# EasyEDA Pro project 级联多电平.epro

# Schematic Schematic1
Assembly Variant: Basic; Board Name: Board1; Create Date: 2026-01-28; Page Name: P1; Project Name: 级联多电平; Schematic Name: Schematic1; Update Date: 2026-01-28; BladeWidth: 10; Company: 嘉立创EDA; Page Size: A4; RegionStart: 1; ShowBorder: 1; TitleBlock: 1; TitleBlockPosition: 3; Version: V1.0; XRegionCount: 6; YRegionCount: 4
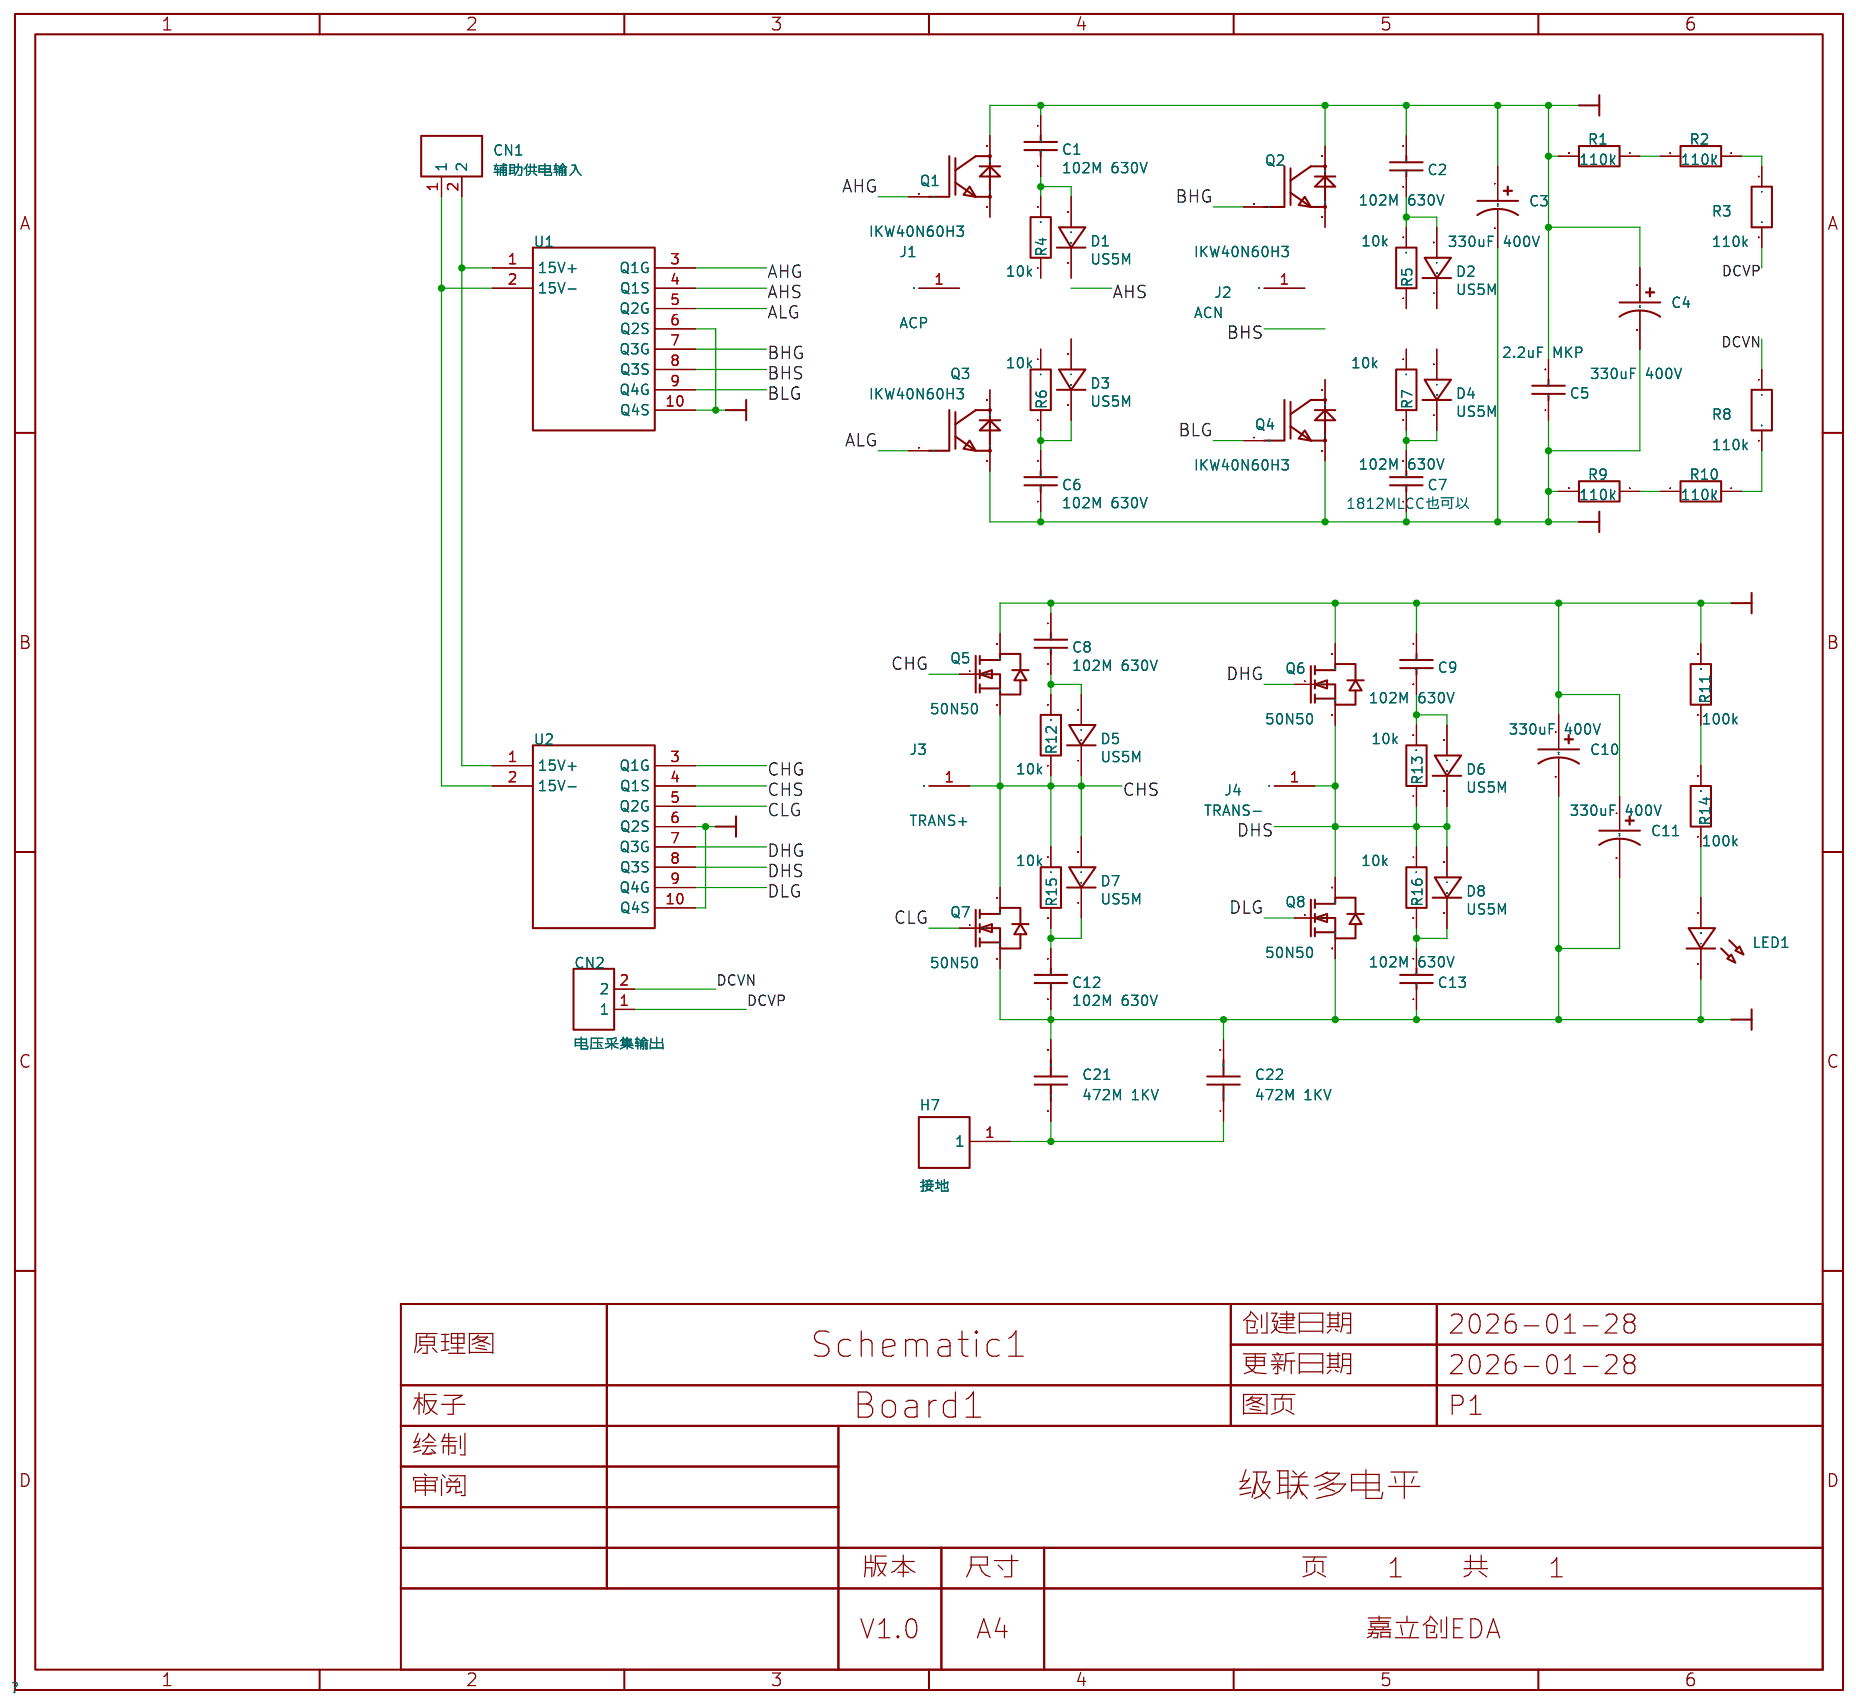
[diagram p0: schematic sheet]

## Parts
C1  102M 630V  [CAP-SMD_L8.0-W6.0-LS11.4]
C2  102M 630V  [CAP-SMD_L8.0-W6.0-LS11.4]
C3  330uF 400V  [CAP-TH_BD25.0-P10.00-D2.0-FD]
C4  330uF 400V  [CAP-TH_BD25.0-P10.00-D2.0-FD]
C5  2.2uF  [31.5*12.5 MKP]
C6  102M 630V  [CAP-SMD_L8.0-W6.0-LS11.4]
C7  102M 630V  [CAP-SMD_L8.0-W6.0-LS11.4]
C8  102M 630V  [CAP-SMD_L8.0-W6.0-LS11.4]
C9  102M 630V  [CAP-SMD_L8.0-W6.0-LS11.4]
C10  330uF 400V  [CAP-TH_BD25.0-P10.00-D2.0-FD]
C11  330uF 400V  [CAP-TH_BD25.0-P10.00-D2.0-FD]
C12  102M 630V  [CAP-SMD_L8.0-W6.0-LS11.4]
C13  102M 630V  [CAP-SMD_L8.0-W6.0-LS11.4]
C21  472M 1KV  [CAP-TH_L12.5-W5.0-P7.50-D1.2]
C22  472M 1KV  [CAP-TH_L12.5-W5.0-P7.50-D1.2]
CN1  辅助供电输入  [CONN-TH_2P-P2.50_HX25003-2A]
CN2  电压采集输出  [CONN-TH_2P-P2.50_HX25003-2A]
D1  US5M  [SMB_L4.3-W3.6-LS5.3-RD]
D2  US5M  [SMB_L4.3-W3.6-LS5.3-RD]
D3  US5M  [SMB_L4.3-W3.6-LS5.3-RD]
D4  US5M  [SMB_L4.3-W3.6-LS5.3-RD]
D5  US5M  [SMB_L4.3-W3.6-LS5.3-RD]
D6  US5M  [SMB_L4.3-W3.6-LS5.3-RD]
D7  US5M  [SMB_L4.3-W3.6-LS5.3-RD]
D8  US5M  [SMB_L4.3-W3.6-LS5.3-RD]
H7  接地  [30A焊盘]
J1  ACP  [PCB-6M3]
J2  ACN  [30A焊盘]
J3  TRANS+  [PCB-6M3]
J4  TRANS-  [30A焊盘]
LED1  -  [LED-TH_5mm]
Q1  IKW40N60H3  [TO-247-3_L15.9-W5.1-P5.44-L]
Q2  IKW40N60H3  [TO-247-3_L15.9-W5.1-P5.44-L]
Q3  IKW40N60H3  [TO-247-3_L15.9-W5.1-P5.44-L]
Q4  IKW40N60H3  [TO-247-3_L15.9-W5.1-P5.44-L]
Q5  50N50  [TO-247-3_L15.8-W5.0-P5.44-L]
Q6  50N50  [TO-247-3_L15.8-W5.0-P5.44-L]
Q7  50N50  [TO-247-3_L15.8-W5.0-P5.44-L]
Q8  50N50  [TO-247-3_L15.8-W5.0-P5.44-L]
R1  110k  [R0805]
R2  110k  [R0805]
R3  110k  [R0805]
R4  10k  [R2512]
R5  10k  [R2512]
R6  10k  [R2512]
R7  10k  [R2512]
R8  110k  [R0805]
R9  110k  [R0805]
R10  110k  [R0805]
R11  100k  [R2512]
R12  10k  [R2512]
R13  10k  [R2512]
R14  100k  [R2512]
R15  10k  [R2512]
R16  10k  [R2512]
U1  -  [级联H桥驱动]
U2  -  [级联H桥驱动]

## Library data of the parts
C1 C2 C6-C9 C12 C13 = 102M 630V: Supplier: LCSC; Supplier Part: C9900002784; Manufacturer Part: 安规Y电容472M 250 400V; Manufacturer: null; JLCPCB Part Class: Extended Part; Contributor: LCSC; spicePre: C; spiceSymbolName: 安规Y电容472M 250 400V
C3 C4 C10 C11 = LSR400M337R352S1AA: 容值:330uF;精度:±20%;额定电压:400V;脚间距:10mm;等效串联电阻(ESR):-;纹波电流:-;; LCSC Part Name: 330uF ±20% 400V; Supplier Part: C47325520; Manufacturer: KNSCHA(科尼盛); Supplier Footprint: 插件,D25xL35mm; JLCPCB Part Class: Extended Part; Datasheet: https://item.szlcsc.com/datasheet/LSR400M337R352S1AA/49533724.html; Supplier: LCSC; Tolerance: ±20%; Voltage Rating: 400V; Pin Spacing: 10mm; Diameter: 25mm; Height - Seated (Max): 35mm; Lifetime: 3000hrs@105℃; Operating Temperature: -25℃~+105℃
C5 = 2.2uF MKP: Voltage: 250vdc; Tolerance: ±10%; Manufacturer: EasyEDA; Manufacturer Part: MKP4F042205I00KSSD; spicePre: C
C21 C22 = 472M 1KV: Supplier: LCSC; Supplier Part: C263262; Manufacturer: Dersonic; Manufacturer Part: CY2472MD14EF48F0A8; JLCPCB Part Class: Extended Part; nameAlias: Capacitance; Contributor: LCSC; spicePre: C; spiceSymbolName: CY2472MD14EF48F0A8 COPY
CN1 CN2 = ZX-XH2.54-2PZZ: 插针结构:1x2P;间距:2.5mm;安装方式:直插;参考系列:XH;总PIN数:2P;排数:1;每排PIN数:2;行距:-;额定电流:2A;触头材质:黄铜;触头镀层:锡;工作温度:-25℃~+85℃;; LCSC Part Name: 1x2P 间距:2.5mm 直插 系列:XH; Supplier Part: C7429632; Manufacturer: Megastar(兆星); Supplier Footprint: 插件,P=2.5mm; JLCPCB Part Class: Extended Part; Datasheet: https://item.szlcsc.com/datasheet/ZX-XH2.54-2PZZ/8427549.html; Supplier: LCSC; Pins Structure: 1x2P; Pitch: 2.5mm; Mounting Type: 直插; Reference Series: XH; Number of Pins: 2P; Number of Rows: 1; Number of PINs Per Row: 2; Current Rating: 2A; Contact Material: 黄铜; Contact Plating: 锡; Operating Temperature: -25℃~+85℃; Voltage Rating: 250V; Plastic Material: PA66; Flame Retardant Rating: UL94V-0; Color: 白色; Z-Height of the Board: 7mm; X-Length of Bottom Edge on Board (Spacing Line): 7.5mm; Y-Width of Bottom Edge on Board: 5.9mm
D1-D8 = US5M: Supplier: LCSC; Supplier Part: C437755; Manufacturer: 晶导微电子; Manufacturer Part: RS5JB; Contributor: LCSC; spicePre: D; spiceSymbolName: RS5JB
H7 = 火线输出: Contributor: liuwen; spicePre: J; spiceSymbolName: 3mm大电流接线端子
J1 J3 = DC+: Contributor: wwf_008; spicePre: U; spiceSymbolName: 长孔M3过孔
J2 J4 = DC-: Contributor: wwf_008; spicePre: U; spiceSymbolName: 长孔M3过孔
LED1 = LED_TH-R_5mm: Supplier Footprint: 插件
Q1-Q4 = IKW40N60H3: IGBT类型:FS(场截止);集射极击穿电压(Vces):600V;集电极电流(Ic):40A;耗散功率(Pd):306W;; LCSC Part Name: 600V 40A; Supplier Part: C128881; Manufacturer: Infineon(英飞凌); Supplier Footprint: TO-247-3; JLCPCB Part Class: Extended Part; Datasheet: https://item.szlcsc.com/datasheet/IKW40N60H3/140167.html; Supplier: LCSC; IGBT Type: FS(场截止); Collector-Emitter Breakdown Voltage (Vces): 600V; Current - Collector(Ic): 40A; Pd - Power Dissipation: 306W; Output Capacitance(Coes): 112pF; Pulsed Current- Forward(Ifm): 160A; Vce Saturation(VCE(sat)): 2.4V@40A,15V; Gate-Emitter Threshold Voltage (Vge(th)@Ic): 4.1V@0.58mA; Gate Charge(Qg): 223nC; Input Capacitance(Cies): 2.19nF; Td(on): 19ns; Td(off): 197ns; Turn-On Energy (Eon): 1.1mJ; Switching Energy(Eoff): 580uJ; Reverse Recovery Time(trr): 124ns; Operating Temperature: -40℃~+175℃; Reverse Transfer Capacitance (Cres): 64pF
Q5-Q8 = B3M040065H: Manufacturer: BASIC; JLCPCB Part Class: Extended Part; Contributor: paking_zhang; spicePre: Q; spiceSymbolName: NCE60NF031T
R1-R3 R8-R10 = 110k: nameAlias: Value(Ω); Contributor: LCEDA_Lib; spicePre: R; spiceSymbolName: R_0805_EU
R4-R7 R11-R16 = 10k: nameAlias: Value(Ω); Contributor: LCEDA_Lib; spicePre: R; spiceSymbolName: R_AXIAL-0.5_EU
U1 U2 = 级联H桥驱动

## Nets
AHG: Q1.1(G) U1.3(Q1G)
AHS: D1.1(C) D3.2(A) J1.1 Q1.3(E) Q3.2(C) R4.1 R6.1 U1.4(Q1S)
ALG: Q3.1(G) U1.5(Q2G)
BHG: Q2.1(G) U1.7(Q3G)
BHS: D2.1(C) D4.2(A) J2.1 Q2.3(E) Q4.2(C) R5.1 R7.1 U1.8(Q3S)
BLG: Q4.1(G) U1.9(Q4G)
CHG: Q5.1(G) U2.3(Q1G)
CHS: D5.1(C) D7.2(A) J3.1 Q5.3(S) Q7.2(D) R12.1 R15.1 U2.4(Q1S)
CLG: Q7.1(G) U2.5(Q2G)
DC+: C1.1 C2.1 C3.1 C4.1 C5.2 C8.1 C9.1 C10.1 C11.1 Q1.2(C) Q2.2(C) Q5.2(D) Q6.2(D) R1.2 R11.2
DC-: C3.2 C4.2 C5.1 C6.1 C7.1 C10.2 C11.2 C12.1 C13.1 C21.2 C22.2 LED1.2(A) Q3.3(E) Q4.3(E) Q7.3(S) Q8.3(S) R9.2 U1.6(Q2S) U1.10(Q4S) U2.6(Q2S) U2.10(Q4S)
DCVN: CN2.2 R8.1
DCVP: CN2.1 R3.2
DHG: Q6.1(G) U2.7(Q3G)
DHS: D6.1(C) D8.2(A) J4.1 Q6.3(S) Q8.2(D) R13.1 R16.1 U2.8(Q3S)
DLG: Q8.1(G) U2.9(Q4G)
$1N24: R9.1 R10.2
$1N25: C6.2 D3.1(C) R6.2
$1N26: C1.2 D1.2(A) R4.2
$1N27: C7.2 D4.1(C) R7.2
$1N29: C2.2 D2.2(A) R5.2
$1N31: R1.1 R2.2
$1N60: C12.2 D7.1(C) R15.2
$1N61: C8.2 D5.2(A) R12.2
$1N62: C13.2 D8.1(C) R16.2
$1N64: C9.2 D6.2(A) R13.2
$1N90: CN1.1 U1.2(15V-) U2.2(15V-)
$1N91: CN1.2 U1.1(15V+) U2.1(15V+)
$1N92: R11.1 R14.2
$1N93: R2.1 R3.1
$1N94: R8.2 R10.1
$1N101: LED1.1(C) R14.1
$1N107: C21.1 C22.1 H7.1

## Notes on the sheet
- 1812MLCC也可以

# Board PCB1
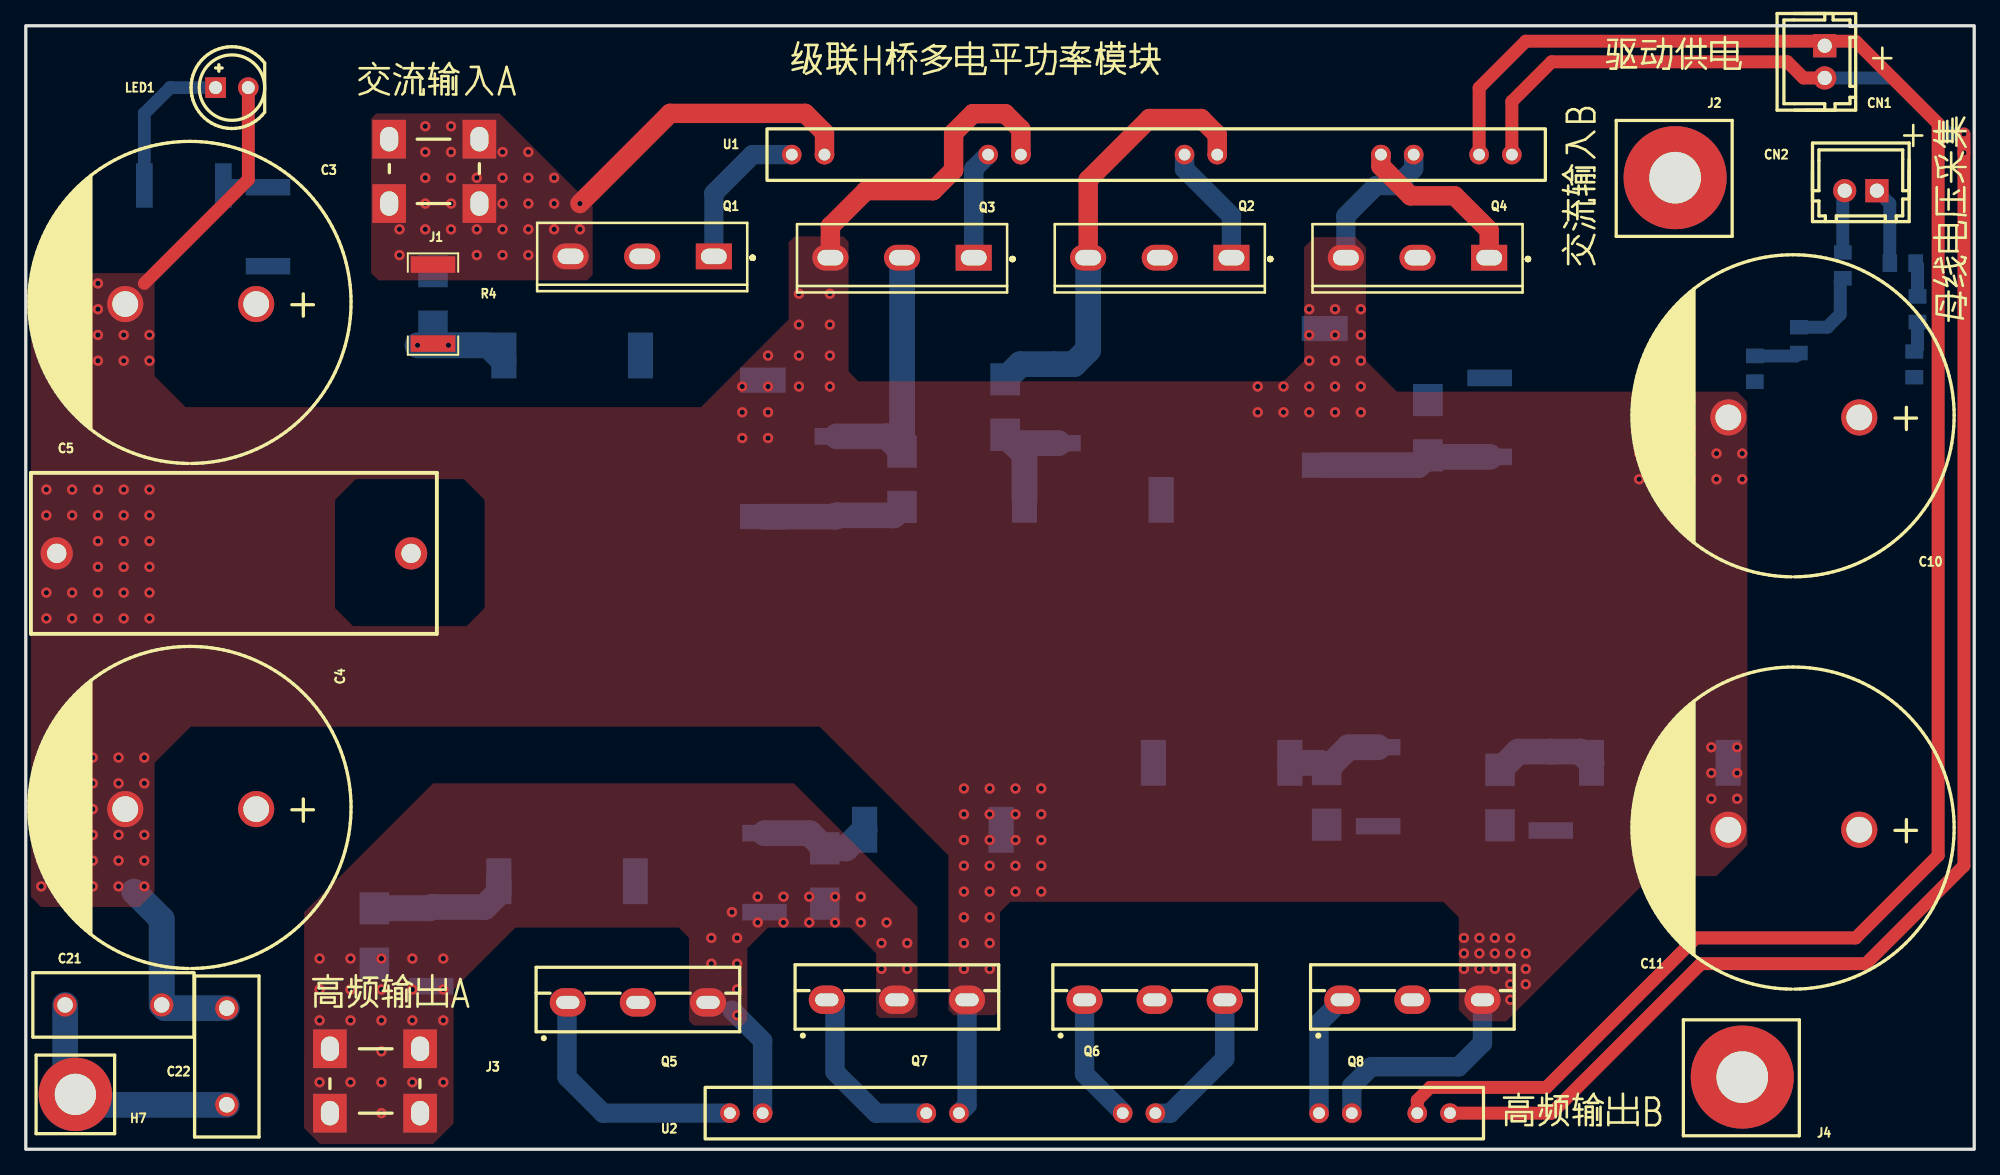
[diagram p1: board, top side]
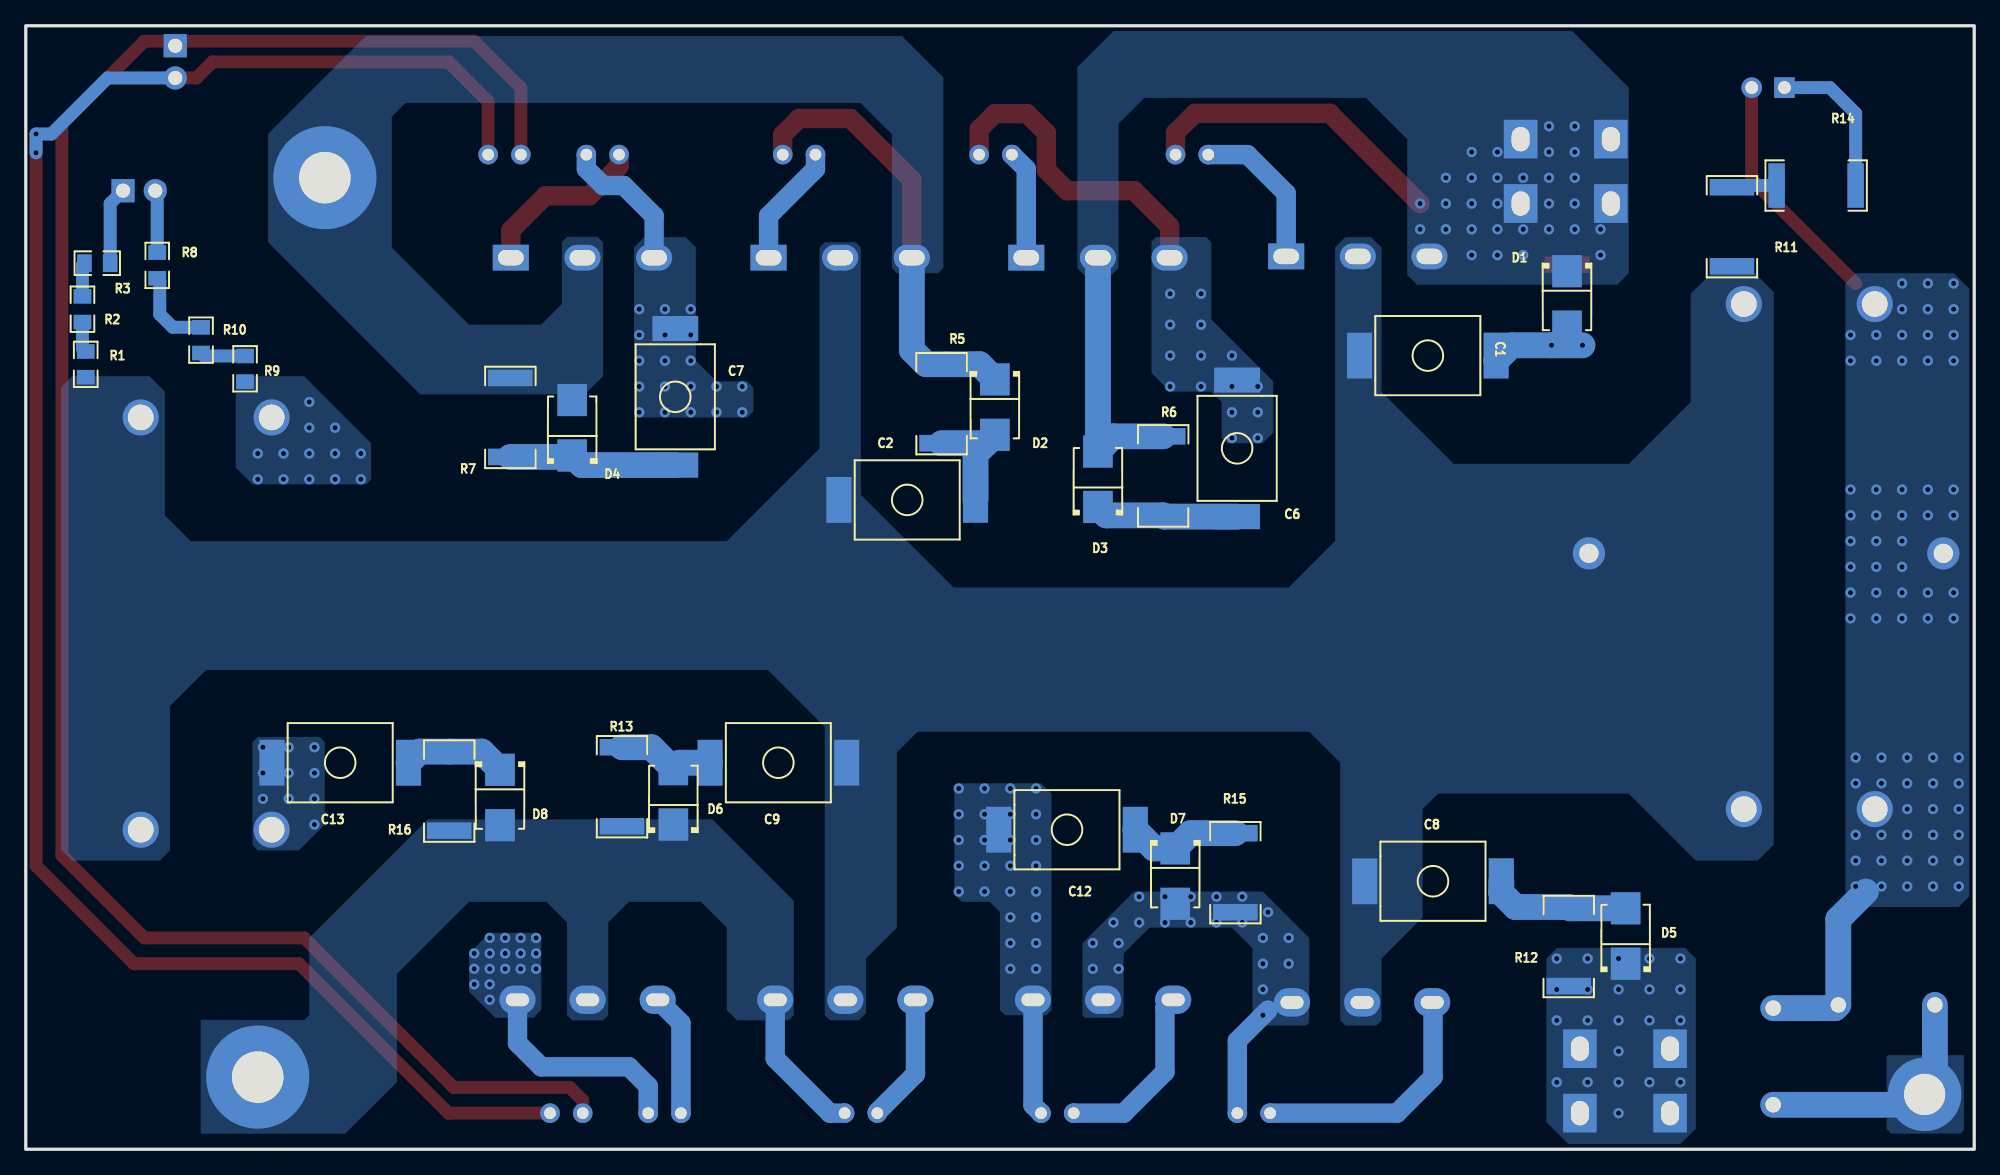
[diagram p2: board, bottom side, seen from below]

Outline 151.2 x 87.2 mm; copper layers: Top Layer, Bottom Layer. Coordinates in mm from the lower left corner of the outline.
Outline path: rectangle 0,87.2 151.2,0
Stack: Top Layer 0.035mm / Dielectric1 1.51mm FR4 er 4.5 / Bottom Layer 0.035mm

## Design rules (mm)
spacing copperThickness1oz (default): track to track 0.102, other pairs 0.152 to 0.3
spacing copperThickness2oz: track to track 0.203, other pairs 0.152 to 0.3
track width copperThickness1oz (default): min 0.127, default 0.254, max 2.54
track width copperThickness2oz: min 0.203, default 0.254, max 2.54
differential pair differentialPair (default): width min 0.127, default 0.254, max 2.54; gap min 0.152, default 0.152

## Placement (name value [footprint] x y rotation side)
C1  102M 630V  [CAP-SMD_L8.0-W6.0-LS11.4]  42.4 61.6 180 bottom
C2  102M 630V  [CAP-SMD_L8.0-W6.0-LS11.4]  82.8 50.4 180 bottom
C3  330uF 400V  [CAP-TH_BD25.0-P10.00-D2.0-FD]  12.8 65.6 180 top
C4  330uF 400V  [CAP-TH_BD25.0-P10.00-D2.0-FD]  12.8 26.4 180 top
C5  2.2uF  [31.5*12.5 MKP]  0.4 40 0 top
C6  102M 630V  [CAP-SMD_L8.0-W6.0-LS11.4]  57.2 54.4 270 bottom
C7  102M 630V  [CAP-SMD_L8.0-W6.0-LS11.4]  100.8 58.4 270 bottom
C8  102M 630V  [CAP-SMD_L8.0-W6.0-LS11.4]  42 20.8 180 bottom
C9  102M 630V  [CAP-SMD_L8.0-W6.0-LS11.4]  92.8 30 0 bottom
C10  330uF 400V  [CAP-TH_BD25.0-P10.00-D2.0-FD]  137.2 56.8 180 top
C11  330uF 400V  [CAP-TH_BD25.0-P10.00-D2.0-FD]  137.2 24.8 180 top
C12  102M 630V  [CAP-SMD_L8.0-W6.0-LS11.4]  70.4 24.8 180 bottom
C13  102M 630V  [CAP-SMD_L8.0-W6.0-LS11.4]  126.8 30 180 bottom
C21  472M 1KV  [CAP-TH_L12.5-W5.0-P7.50-D1.2]  6.8 11.2 0 top
C22  472M 1KV  [CAP-TH_L12.5-W5.0-P7.50-D1.2]  15.6 7.2 90 top
CN1  辅助供电输入  [CONN-TH_2P-P2.50_HX25003-2A]  139.6 84.4 270 top
CN2  电压采集输出  [CONN-TH_2P-P2.50_HX25003-2A]  142.4 74.4 180 top
D1  US5M  [SMB_L4.3-W3.6-LS5.3-RD]  31.6 66 270 bottom
D2  US5M  [SMB_L4.3-W3.6-LS5.3-RD]  76 57.6 270 bottom
D3  US5M  [SMB_L4.3-W3.6-LS5.3-RD]  68 52 90 bottom
D4  US5M  [SMB_L4.3-W3.6-LS5.3-RD]  108.8 56 90 bottom
D5  US5M  [SMB_L4.3-W3.6-LS5.3-RD]  27.05 16.55 90 bottom
D6  US5M  [SMB_L4.3-W3.6-LS5.3-RD]  100.95 27.35 90 bottom
D7  US5M  [SMB_L4.3-W3.6-LS5.3-RD]  62 21.2 270 bottom
D8  US5M  [SMB_L4.3-W3.6-LS5.3-RD]  114.4 27.3 270 bottom
H7  接地  [30A焊盘]  3.85 4.26 0 top
J1  ACP  [PCB-6M3]  35.2 78.4 270 top
J2  ACN  [30A焊盘#2]  127.99 75.41 0 top
J3  TRANS+  [PCB-6M3]  23.6 2.8 90 top
J4  TRANS-  [30A焊盘#2]  133.2 5.6 0 top
LED1  -  [LED-TH_5mm]  16 82.4 0 top
Q1  IKW40N60H3  [TO-247-3_L15.9-W5.1-P5.44-L]  47.83 69.3 180 top
Q2  IKW40N60H3  [TO-247-3_L15.9-W5.1-P5.44-L]  88 69.2 180 top
Q3  IKW40N60H3  [TO-247-3_L15.9-W5.1-P5.44-L]  68 69.2 180 top
Q4  IKW40N60H3  [TO-247-3_L15.9-W5.1-P5.44-L]  108 69.2 180 top
Q5  50N50  [TO-247-3_L15.8-W5.0-P5.44-L]  47.5 11.4 0 top
Q6  50N50  [TO-247-3_L15.8-W5.0-P5.44-L]  87.6 11.6 0 top
Q7  50N50  [TO-247-3_L15.8-W5.0-P5.44-L]  67.6 11.6 0 top
Q8  50N50  [TO-247-3_L15.8-W5.0-P5.44-L]  107.6 11.6 0 top
R1  110k  [R0805]  146.55 60.92 270 bottom
R2  110k  [R0805]  146.8 65.2 270 bottom
R3  110k  [R0805]  145.65 68.77 180 bottom
R4  10k  [R2512]  31.6 65.6 270 top
R5  10k  [R2512]  80.13 57.87 270 bottom
R6  10k  [R2512]  62.93 52.27 270 bottom
R7  10k  [R2512]  113.6 56.8 270 bottom
R8  110k  [R0805]  141 68.6 270 bottom
R9  110k  [R0805]  134.18 60.57 270 bottom
R10  110k  [R0805]  137.6 62.8 270 bottom
R11  100k  [R2512]  18.8 71.6 270 bottom
R12  10k  [R2512]  31.47 15.73 90 bottom
R13  10k  [R2512]  104.93 28.13 90 bottom
R14  100k  [R2512]  12.27 74.8 0 bottom
R15  10k  [R2512]  57.33 21.47 90 bottom
R16  10k  [R2512]  118.34 27.8 90 bottom
U1  -  [级联H桥驱动]  69.6 77.2 0 top
U2  -  [级联H桥驱动]  64.8 2.8 0 top

## Footprints (pads in the part's own frame, mm; a bottom-side part is the same pattern mirrored in y, then rotated)
30A焊盘
  round 5.7 hole 3.2: 1(0,0)
30A焊盘#2
  round 8 hole 4: 1(0,0)
31.5*12.5 MKP
  round 2.5 hole 1.5: 1(2,6.25) 2(29.5,6.25)
CAP-SMD_L8.0-W6.0-LS11.4
  rect 1.95x3.556 smd: 1(-5.3,0) 2(5.3,0)
CAP-TH_BD25.0-P10.00-D2.0-FD
  round 2.8 hole 2: 1(-5.08,0) 2(5.08,0)
CAP-TH_L12.5-W5.0-P7.50-D1.2
  round 1.8 hole 1.2: 1(-3.75,0) 2(3.75,0)
CONN-TH_2P-P2.50_HX25003-2A
  rect 1.8x1.8 hole 1.1: 1(-1.25,0)
  round 1.8 hole 1.1: 2(1.25,0)
LED-TH_5mm
  rect 1.6x1.6 hole 1: 1(-1.27,0)
  round 1.6 hole 1: 2(1.27,0)
PCB-6M3
  rect 3x2.6 hole 1.9x1.4: 1(0,0) 1(0,-7) 1(5,0) 1(5,-7)
R0805
  rect 1.133x1.377 smd: 1(-1,0) 2(1,0)
R2512
  rect 1.282x3.456 smd: 1(-3.066,0) 2(3.066,0)
SMB_L4.3-W3.6-LS5.3-RD
  rect 2.5x2.3 smd: 1(-2.15,0) 2(2.15,0)
TO-247-3_L15.8-W5.0-P5.44-L
  oval 2.8x2.2 hole 1.8x1: 1(-5.44,0) 2(0,0) 3(5.44,0)
TO-247-3_L15.9-W5.1-P5.44-L
  rect 2.8x2 hole 2x1.2: 1(-5.56,0)
  oval 2.8x2 hole 2x1.2: 2(0,0) 3(5.56,0)
级联H桥驱动
  round 1.524 hole 0.914: 1(45.72,0) 2(43.18,0) 3(-10.16,0) 4(-7.62,0) 5(5.08,0) 6(7.62,0) 7(20.32,0) 8(22.86,0) 9(35.56,0) 10(38.1,0)

## Nets
As in the schematic.

## Via types
v1: diameter 0.8, hole 0.4, Top Layer to Bottom Layer, 248 vias

## Routing (per net, layer and track width the routed paths; a pad name or vN(x,y) marks a point on that pad's centre or on a via; arc(x,y) is an arc through that point)
AHG: length 12.2
  Bottom Layer w1.5: U1.3 56.4,77.2 53.39,74.19 Q1.1
AHS: length 44.1
  Top Layer w1.5: U1.4 61.98,78.9 60.48,80.4 50,80.4 v1(43,73.4)
  Bottom Layer w2: R6.1 66.82,55.33 D3.2 ; Q3.2 68,54.85
  vias: v1(29,71.4) v1(29,69.4) v1(31,79.4) v1(31,77.4) v1(31,75.4) v1(31,73.4) v1(31,71.4) v1(33,79.4) v1(33,77.4) v1(33,75.4) v1(33,73.4) v1(33,71.4) v1(35,75.4) v1(35,71.4) v1(35,69.4) v1(37,77.4) v1(37,75.4) v1(37,73.4) v1(37,71.4) v1(37,69.4) v1(39,77.4) v1(39,75.4) v1(39,73.4) v1(39,71.4) v1(39,69.4) v1(41,75.4) v1(41,73.4) v1(41,71.4) v1(43,71.4)
ALG: length 8.5
  Bottom Layer w1.5: U1.5 73.56,76.08 Q3.1
BHG: length 9.5
  Bottom Layer w1.5: U1.7 89.92,76.08 93.56,72.44 Q2.1
BHS: length 34.6
  Top Layer w1.5: Q2.3 82.44,75.24 87.2,80 91.2,80 92.46,78.74 U1.8
  Bottom Layer w2: Q2.3 82.44,62.04 81.33,60.93 77.18,60.93 D2.1
BLG: length 13.5
  Top Layer w1.5: U1.9 105.16,76.3 107.46,74 110.88,74 113.56,71.32 Q4.1
CHG: length 19.6
  Bottom Layer w1.5: U2.3 44.8,2.8 42,5.6 42,11.34 Q5.1
CHS: length 9
  Bottom Layer w1.5: U2.4 57.18,8.42 v1(55.2,10.4) 54.8,10.8
  vias: v1(22.8,14.8) v1(22.8,12.4) v1(22.8,10) v1(22.8,5.2) v1(25.2,14.8) v1(25.2,12.4) v1(25.2,10) v1(25.2,5.2) v1(27.6,14.8) v1(27.6,12.4) v1(27.6,10) v1(27.6,7.6) v1(27.6,5.2) v1(27.6,2.8) v1(30,14.8) v1(30,12.4) v1(30,10) v1(30,5.2) v1(32.4,14.8) v1(32.4,12.4) v1(32.4,10) v1(32.4,5.2) v1(53.2,16.4) v1(53.2,14.4) v1(54.8,18.4) v1(55.2,16.4) v1(55.2,14.4) v1(55.2,12.4) v1(56.8,19.6) v1(56.8,17.6) v1(58.8,19.6) v1(58.8,17.6) v1(60.8,19.6) v1(60.8,17.6) v1(62.8,19.6) v1(62.8,17.6) v1(64.8,19.6) v1(64.8,17.6) v1(66.4,16) v1(66.4,14) v1(66.8,17.6) v1(68.4,16) v1(68.4,14)
CLG: length 14.3
  Bottom Layer w1.5: U2.5 66,2.8 62.8,6 62.8,10.96 Q7.1
DC-: length 95.5
  Top Layer w1: 9.2,67.2 17.27,75.27 LED1.2
  Top Layer w1.5: Q3.3 62.44,71.64 65.2,74.4 70.4,74.4 72,76 72,78.88 73.5,80.38 76,80.38 77.22,79.16 U1.6
  Bottom Layer w1.5: U1.10 107.7,76.1 106.4,74.8 104.8,74.8 102.44,72.44 Q4.3 ; U2.6 73.04,3.42 Q7.3 ; U2.10 102.9,4.9 104.4,6.4 111.2,6.4 113.04,8.24 Q8.3
  Bottom Layer w2: C22.2 10.8,10.95 C21.2 10.55,17.85 8.4,20
  vias: v1(1.2,30.4) v1(1.2,28.4) v1(1.2,26.4) v1(1.2,24.4) v1(1.2,22.4) v1(1.2,20.4) v1(1.6,67.2) v1(1.6,65.2) v1(1.6,63.2) v1(1.6,61.2) v1(1.6,51.2) v1(1.6,49.2) v1(1.6,43.2) v1(1.6,41.2) v1(3.2,30.4) v1(3.2,28.4) v1(3.2,26.4) v1(3.2,24.4) v1(3.2,22.4) v1(3.2,20.4) v1(3.6,67.2) v1(3.6,65.2) v1(3.6,63.2) v1(3.6,61.2) v1(3.6,51.2) v1(3.6,49.2) v1(3.6,43.2) v1(3.6,41.2) v1(5.2,30.4) v1(5.2,28.4) v1(5.2,26.4) v1(5.2,24.4) v1(5.2,22.4) v1(5.2,20.4) v1(5.6,67.2) v1(5.6,65.2) v1(5.6,63.2) v1(5.6,61.2) v1(5.6,51.2) v1(5.6,49.2) v1(5.6,47.2) v1(5.6,45.2) v1(5.6,43.2) v1(5.6,41.2) v1(7.2,30.4) v1(7.2,28.4) v1(7.2,24.4) v1(7.2,22.4) v1(7.2,20.4) v1(7.6,63.2) v1(7.6,61.2) v1(7.6,51.2) v1(7.6,49.2) v1(7.6,47.2) v1(7.6,45.2) v1(7.6,43.2) v1(7.6,41.2) v1(9.2,30.4) v1(9.2,28.4) v1(9.2,24.4) v1(9.2,22.4) v1(9.2,20.4) v1(9.6,63.2) v1(9.6,61.2) v1(9.6,51.2) v1(9.6,49.2) v1(9.6,47.2) v1(9.6,45.2) v1(9.6,43.2) v1(9.6,41.2) v1(55.6,59.2) v1(55.6,57.2) v1(55.6,55.2) v1(57.6,61.6) v1(57.6,59.2) v1(57.6,57.2) v1(57.6,55.2) v1(60,66.4) v1(60,64) v1(60,61.6) v1(60,59.2) v1(62.4,66.4) v1(62.4,64) v1(62.4,61.6) v1(62.4,59.2) v1(72.8,28) v1(72.8,26) v1(72.8,24) v1(72.8,22) v1(72.8,20) v1(72.8,18) v1(72.8,16) v1(72.8,14) v1(74.8,28) v1(74.8,26) v1(74.8,24) v1(74.8,22) v1(74.8,20) v1(74.8,18) v1(74.8,16) v1(74.8,14) v1(76.8,28) v1(76.8,26) v1(76.8,24) v1(76.8,22) v1(76.8,20) v1(78.8,28) v1(78.8,26) v1(78.8,24) v1(78.8,22) v1(78.8,20) v1(95.6,59.2) v1(95.6,57.2) v1(97.6,59.2) v1(97.6,57.2) v1(99.6,65.2) v1(99.6,63.2) v1(99.6,61.2) v1(99.6,59.2) v1(99.6,57.2) v1(101.6,65.2) v1(101.6,63.2) v1(101.6,61.2) v1(101.6,59.2) v1(101.6,57.2) v1(103.6,65.2) v1(103.6,63.2) v1(103.6,61.2) v1(103.6,59.2) v1(103.6,57.2) v1(111.6,16.4) v1(111.6,15.2) v1(111.6,14) v1(112.8,16.4) v1(112.8,15.2) v1(112.8,14) v1(114,16.4) v1(114,15.2) v1(114,14) v1(115.2,16.4) v1(115.2,15.2) v1(115.2,14) v1(115.2,12.8) v1(115.2,11.6) v1(116.4,15.2) v1(116.4,14) v1(116.4,12.8) v1(125.2,54) v1(125.2,52) v1(127.2,56) v1(127.2,54) v1(127.2,52) v1(128.8,31.2) v1(128.8,29.2) v1(128.8,27.2) v1(128.8,25.2) v1(129.2,58) v1(129.2,56) v1(129.2,54) v1(129.2,52) v1(130.8,31.2) v1(130.8,29.2) v1(130.8,27.2) v1(131.2,54) v1(131.2,52) v1(132.8,31.2) v1(132.8,29.2) v1(132.8,27.2) v1(133.2,54) v1(133.2,52)
DCVN: length 5.1
  Bottom Layer w1: 140.8,74.65 141,74.45 R8.1
DCVP: length 6
  Bottom Layer w1: CN2.1 144.65,73.4 R3.2
DHG: length 9.9
  Bottom Layer w1.5: 85.12,2.88 82.16,5.84 Q6.1
DHS: length 11.7
  Bottom Layer w1.5: Q6.3 93.04,7.04 88.8,2.8 U2.8
DLG: length 9.5
  Bottom Layer w1.5: Q8.1 100.36,9.8 U2.9
$1N24: length 3.5
  Bottom Layer w1: R9.1 137.37,61.57 R10.2
$1N25: length 11.1
  Bottom Layer w2: C6.2 62.83,49.1 R6.2 67.35,49.2 D3.1
$1N26: length 7.2
  Bottom Layer w2: 37.1,61.2 35.9,62.4 v1(32.8,62.4) v1(30.4,62.4)
$1N27: length 13.2
  Bottom Layer w2: C7.2 108.05,53.1 D4.1 108.92,53.73 R7.2
$1N29: length 9.2
  Bottom Layer w2: R5.2 76.65,54.8 ; 76.65,54.8 D2.2 ; 76.65,54.8 77.5,53.95 C2.2
$1N31: length 2.4
  Bottom Layer w1: R2.2 146.8,62.17 R1.1
$1N60: length 8.9
  Bottom Layer w2: C12.2 63.65,23.35 D7.1 60.82,24.53 R15.2
$1N61: length 11
  Bottom Layer w2: D5.2 31.37,18.7 R12.2 35.6,18.8 36.7,19.9 C8.2
$1N62: length 8
  Bottom Layer w2: D8.1 115.81,30.86 R16.2 120.64,30.86 C13.2
$1N64: length 7.7
  Bottom Layer w2: R13.2 102.65,31.2 D6.2 100.45,30 C9.2
$1N90: length 151.5
  Top Layer w1: 139.25,86 116.4,86 112.78,82.38 U1.2 ; 139.25,86 142,86 148.4,79.6 148.4,22.8 142,16.4 129.6,16.4 118,4.8 108.98,4.8 107.98,3.8 U2.2 ; 139.25,86 CN1.1
$1N91: length 148.9
  Top Layer w1: v1(150.4,78.8) v1(150.4,77.34) 150.4,22 142.8,14.4 130,14.4 118.4,2.8 U2.1 ; U1.1 115.32,81.32 118.4,84.4 136.7,84.4 137.95,83.15 CN1.2
  Bottom Layer w1: CN1.2 144.85,83.15 149.2,78.8 v1(150.4,78.8) v1(150.4,77.34)
$1N92: length 3.5
  Bottom Layer w1: R11.1 18.67,74.8 R14.2
$1N93: length 2.6
  Bottom Layer w1: R3.1 146.8,68.62 R2.1
$1N94: length 6.5
  Bottom Layer w1: R10.1 139.8,63.8 140.8,64.8 140.8,67.4 R8.2
$1N101: length 12
  Bottom Layer w1: R14.1 9.2,80.4 11.2,82.4 LED1.1
$1N107: length 19.4
  Bottom Layer w2: C22.1 4.65,3.45 H7.1 3.05,5.05 C21.1

## Copper pours and planes (outline as drawn; the poured copper is in the pictures)
AHS on Top Layer: 26.8,80.4 44,80.4 44,67.44 26.8,67.44
AHS on Bottom Layer: 26.8,86.8 69.6,86.8 69.6,67.1 26.8,67.1
BHS on Bottom Layer: 80,86.4 132.4,86.4 132.4,58.6 80,58.6
CHS on Top Layer: 21.59,28.4 69.2,28.4 69.2,0.4 21.59,0.4
CHS on Bottom Layer: 51.6,20 69.2,20 69.2,9.6 51.6,9.6
CHS on Bottom Layer: 21.6,15.63 33.2,15.63 33.2,0.4 21.6,0.4
DC+ on Bottom Layer: 15.56,70.8 148.44,70.8 148.44,9.6 15.56,9.6
DC- on Top Layer: 0.4,70.85 133.6,70.85 133.6,9.93 0.4,9.93
DC- on Bottom Layer: 124.4,60.12 134.9,60.12 134.9,51.6 124.4,51.6
DC- on Bottom Layer: 128,32 133.6,32 133.6,23.2 128,23.2
DC- on Bottom Layer: 54.4,70.8 63.85,70.8 63.85,54.8 54.4,54.8
DC- on Bottom Layer: 111.2,16.8 116.8,16.8 116.8,10.2 111.2,10.2
DC- on Bottom Layer: 0.39,68 10,68 10,18.8 0.39,18.8
DC- on Bottom Layer: 71.6,28.4 79.15,28.4 79.15,10.4 71.6,10.4
DC- on Bottom Layer: 94.74,70.8 104,70.8 104,56.8 94.74,56.8
DHS on Bottom Layer: 91.6,25.6 137.63,25.6 137.63,1.2 91.6,1.2
$1N107 on Bottom Layer: 0.8,7.3 6.8,7.3 6.8,1.21 0.8,1.21

## Text on the board
Top Silkscreen Layer: + | 高频输出A | 交流输入A | 级联H桥多电平功率模块 | 高频输出B | 驱动供电 | 交流输入B | 母线电压采集
